# Altium schematic sheet Top-Sheet.SchDoc
size A4; SheetNumber: 1; SheetTotal: 3
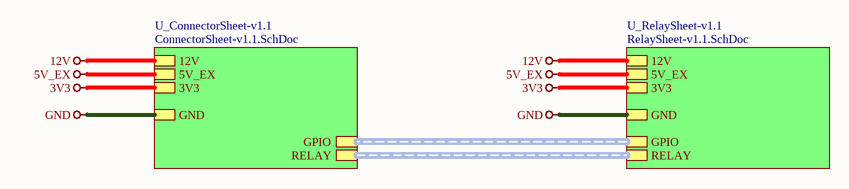
[diagram p0: Top-Sheet.SchDoc]

## Sub-sheets
U_ConnectorSheet-v1.1 = ConnectorSheet-v1.1.SchDoc: 12V, 5V_EX, GND, 3V3, GPIO (harness GPIO), RELAY (harness RELAY)
U_RelaySheet-v1.1 = RelaySheet-v1.1.SchDoc: 12V, 5V_EX, GND, 3V3, GPIO (harness GPIO), RELAY (harness RELAY)

## Nets
3V3: sheet U_ConnectorSheet-v1.1/3V3, sheet U_RelaySheet-v1.1/3V3
5V_EX: sheet U_ConnectorSheet-v1.1/5V_EX, sheet U_RelaySheet-v1.1/5V_EX
12V: sheet U_ConnectorSheet-v1.1/12V, sheet U_RelaySheet-v1.1/12V
GND: sheet U_ConnectorSheet-v1.1/GND, sheet U_RelaySheet-v1.1/GND

## Buses and harness runs
harness sheet U_ConnectorSheet-v1.1/GPIO = sheet U_RelaySheet-v1.1/GPIO
harness sheet U_ConnectorSheet-v1.1/RELAY = sheet U_RelaySheet-v1.1/RELAY

## Notes on the sheet
- File:
- Title:
- Date:
- Page
- Num:
- Total:
- Drawn By: Huzaifa Ali